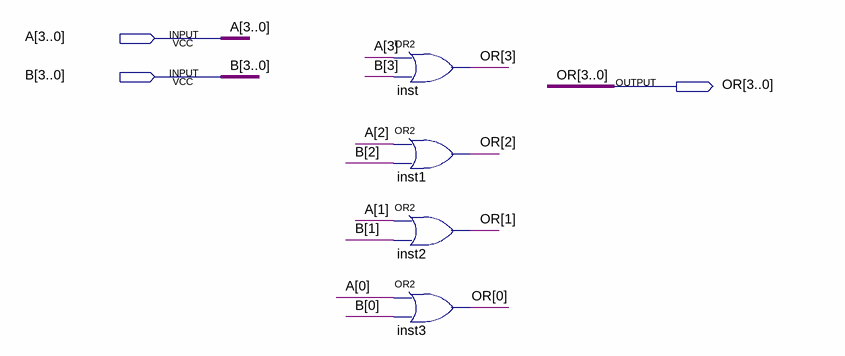
[diagram p0: schematic sheet]
// Quartus schematic OR_4bit.bdf as structural Verilog: 4 symbols, 3 pins
module OR_4bit (
  input  [3:0] A,
  input  [3:0] B,
  output [3:0] OR
);

  or inst (OR[3], A[3], B[3]);
  or inst1 (OR[2], A[2], B[2]);
  or inst2 (OR[1], A[1], B[1]);
  or inst3 (OR[0], A[0], B[0]);
endmodule
